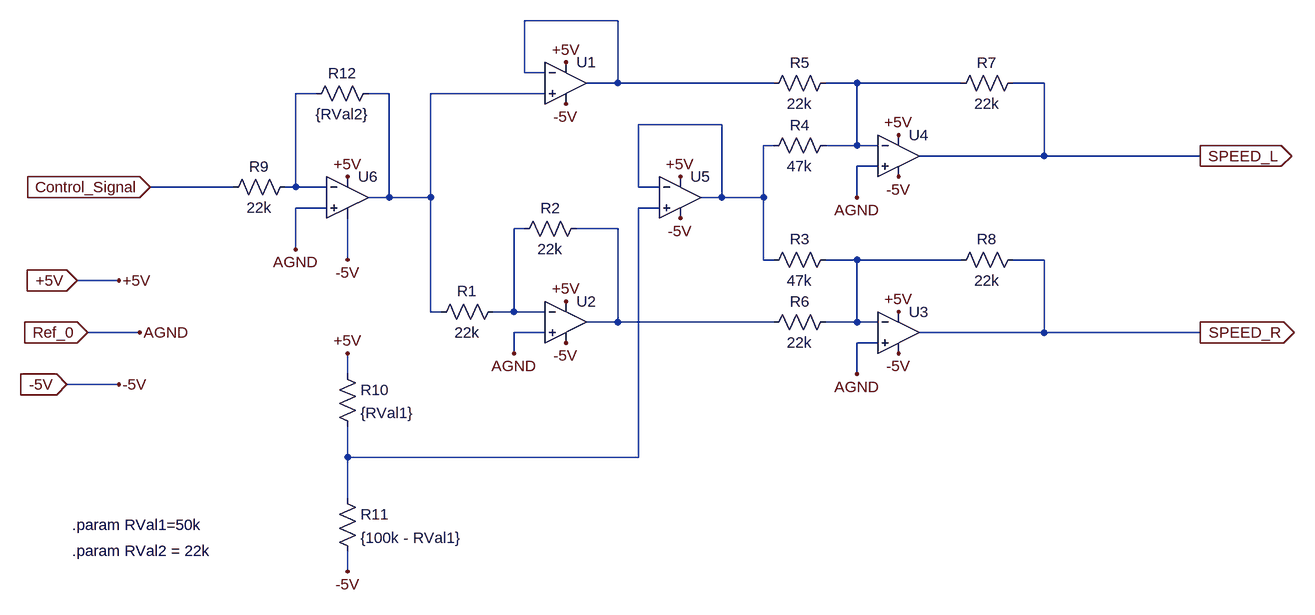
[diagram p0: schematic Differential_Drive_Mixer.asc]
Differential_Drive_Mixer.asc, the LTspice schematic file:
Version 4.1
SHEET 1 1508 1112
WIRE 80 -32 -64 -32
WIRE -64 48 -64 -32
WIRE -32 48 -64 48
WIRE 80 64 80 -32
WIRE 80 64 32 64
WIRE 320 64 80 64
WIRE 448 64 400 64
WIRE 608 64 448 64
WIRE 736 64 688 64
WIRE -384 80 -416 80
WIRE -272 80 -304 80
WIRE -32 80 -208 80
WIRE 240 128 112 128
WIRE 320 160 304 160
WIRE 448 160 448 64
WIRE 448 160 400 160
WIRE 480 160 448 160
WIRE 736 176 736 64
WIRE 736 176 544 176
WIRE 976 176 736 176
WIRE 480 192 448 192
WIRE -512 224 -640 224
WIRE -416 224 -416 80
WIRE -416 224 -432 224
WIRE -368 224 -416 224
WIRE 112 224 112 128
WIRE 144 224 112 224
WIRE -272 240 -272 80
WIRE -272 240 -304 240
WIRE -208 240 -208 80
WIRE -208 240 -272 240
WIRE 240 240 240 128
WIRE 240 240 208 240
WIRE 304 240 304 160
WIRE 304 240 240 240
WIRE 448 240 448 192
WIRE -368 256 -416 256
WIRE 144 256 112 256
WIRE -64 288 -80 288
WIRE 80 288 16 288
WIRE -416 320 -416 256
WIRE -336 336 -336 272
WIRE 304 336 304 240
WIRE 320 336 304 336
WIRE 448 336 400 336
WIRE 608 336 448 336
WIRE 736 336 688 336
WIRE -688 368 -752 368
WIRE -208 416 -208 240
WIRE -192 416 -208 416
WIRE -80 416 -80 288
WIRE -80 416 -112 416
WIRE -32 416 -80 416
WIRE 80 432 80 288
WIRE 80 432 32 432
WIRE 320 432 80 432
WIRE 448 432 448 336
WIRE 448 432 400 432
WIRE 480 432 448 432
WIRE -656 448 -736 448
WIRE -32 448 -80 448
WIRE 736 448 736 336
WIRE 736 448 544 448
WIRE 976 448 736 448
WIRE 480 464 448 464
WIRE -80 480 -80 448
WIRE -336 512 -336 480
WIRE 448 512 448 464
WIRE -688 528 -768 528
WIRE -336 640 -336 592
WIRE 112 640 112 256
WIRE 112 640 -336 640
WIRE -336 704 -336 640
WIRE -336 816 -336 784
FLAG -640 224 Control_Signal
IOPIN -640 224 In
FLAG -336 208 +5V
FLAG -336 336 -5V
FLAG 0 32 +5V
FLAG 0 96 -5V
FLAG 0 400 +5V
FLAG 512 480 -5V
FLAG 0 464 -5V
FLAG 512 416 +5V
FLAG 512 208 -5V
FLAG 512 144 +5V
FLAG 976 176 SPEED_L
IOPIN 976 176 Out
FLAG 976 448 SPEED_R
IOPIN 976 448 Out
FLAG 176 208 +5V
FLAG 176 272 -5V
FLAG -768 528 -5V
IOPIN -768 528 In
FLAG -688 528 -5V
FLAG -752 368 +5V
IOPIN -752 368 In
FLAG -688 368 +5V
FLAG 448 240 AGND
FLAG 448 512 AGND
FLAG -416 320 AGND
FLAG -80 480 AGND
FLAG -736 448 Ref_0
IOPIN -736 448 In
FLAG -656 448 AGND
FLAG -336 480 +5V
FLAG -336 816 -5V
SYMBOL OpAmps\\UniversalOpAmp2 0 64 R0
SYMATTR InstName U1
SYMATTR Value2 Avol=200k GBW=3Meg Slew=13Meg
SYMATTR SpiceLine Ilimit=25m Rail=1.5 Vos=3m
SYMATTR SpiceLine2 En=18n Enk=100 In=0.01p Ink=10 Rin=1T
SYMBOL OpAmps\\UniversalOpAmp2 0 432 R0
SYMATTR InstName U2
SYMATTR Value2 Avol=200k GBW=3Meg Slew=13Meg
SYMATTR SpiceLine Ilimit=25m Rail=1.5 Vos=3m
SYMATTR SpiceLine2 En=18n Enk=100 In=0.01p Ink=10 Rin=1T
SYMBOL res -96 400 R90
WINDOW 0 0 56 VBottom 2
WINDOW 3 32 56 VTop 2
SYMATTR InstName R1
SYMATTR Value 22k
SYMBOL res 32 272 R90
WINDOW 0 0 56 VBottom 2
WINDOW 3 32 56 VTop 2
SYMATTR InstName R2
SYMATTR Value 22k
SYMBOL res 416 320 R90
WINDOW 0 0 56 VBottom 2
WINDOW 3 32 56 VTop 2
SYMATTR InstName R3
SYMATTR Value 47k
SYMBOL res 416 144 R90
WINDOW 0 0 56 VBottom 2
WINDOW 3 32 56 VTop 2
SYMATTR InstName R4
SYMATTR Value 47k
SYMBOL res 416 48 R90
WINDOW 0 0 56 VBottom 2
WINDOW 3 32 56 VTop 2
SYMATTR InstName R5
SYMATTR Value 22k
SYMBOL res 416 416 R90
WINDOW 0 0 56 VBottom 2
WINDOW 3 32 56 VTop 2
SYMATTR InstName R6
SYMATTR Value 22k
SYMBOL OpAmps\\UniversalOpAmp2 512 448 R0
SYMATTR InstName U3
SYMATTR Value2 Avol=200k GBW=3Meg Slew=13Meg
SYMATTR SpiceLine Ilimit=25m Rail=1.5 Vos=3m
SYMATTR SpiceLine2 En=18n Enk=100 In=0.01p Ink=10 Rin=1T
SYMBOL OpAmps\\UniversalOpAmp2 512 176 R0
SYMATTR InstName U4
SYMATTR Value2 Avol=200k GBW=3Meg Slew=13Meg
SYMATTR SpiceLine Ilimit=25m Rail=1.5 Vos=3m
SYMATTR SpiceLine2 En=18n Enk=100 In=0.01p Ink=10 Rin=1T
SYMBOL res 704 48 R90
WINDOW 0 0 56 VBottom 2
WINDOW 3 32 56 VTop 2
SYMATTR InstName R7
SYMATTR Value 22k
SYMBOL res 704 320 R90
WINDOW 0 0 56 VBottom 2
WINDOW 3 32 56 VTop 2
SYMATTR InstName R8
SYMATTR Value 22k
SYMBOL OpAmps\\UniversalOpAmp2 176 240 R0
SYMATTR InstName U5
SYMATTR Value2 Avol=200k GBW=3Meg Slew=13Meg
SYMATTR SpiceLine Ilimit=25m Rail=1.5 Vos=3m
SYMATTR SpiceLine2 En=18n Enk=100 In=0.01p Ink=10 Rin=1T
SYMBOL OpAmps\\UniversalOpAmp2 -336 240 R0
SYMATTR InstName U6
SYMATTR Value2 Avol=200k GBW=3Meg Slew=13Meg
SYMATTR SpiceLine Ilimit=25m Rail=1.5 Vos=3m
SYMATTR SpiceLine2 En=18n Enk=100 In=0.01p Ink=10 Rin=1T
SYMBOL res -416 208 R90
WINDOW 0 0 56 VBottom 2
WINDOW 3 32 56 VTop 2
SYMATTR InstName R9
SYMATTR Value 22k
SYMBOL res -288 64 R90
WINDOW 0 0 56 VBottom 2
WINDOW 3 32 56 VTop 2
SYMATTR InstName R12
SYMATTR Value {RVal2}
SYMBOL res -352 496 R0
SYMATTR InstName R10
SYMATTR Value {RVal1}
SYMBOL res -352 688 R0
SYMATTR InstName R11
SYMATTR Value {100k - RVal1}
TEXT -760 744 Left 2 !.param RVal1=50k
TEXT -760 784 Left 2 !.param RVal2 = 22k

The netlist it stands for:
* Differential_Drive_Mixer.asc
X§U1 N004 N001 +5V -5V N001 level2 Avol=200k GBW=3Meg Slew=13Meg Ilimit=25m Rail=1.5 Vos=3m En=18n Enk=100 In=0.01p Ink=10 Rin=1T  ; pins In+ In- V+ V- OUT
X§U2 Ref_0 N007 +5V -5V N008 level2 Avol=200k GBW=3Meg Slew=13Meg Ilimit=25m Rail=1.5 Vos=3m En=18n Enk=100 In=0.01p Ink=10 Rin=1T  ; pins In+ In- V+ V- OUT
R1 N007 N004 22k
R2 N008 N007 22k
R3 N009 N005 47k
R4 N002 N005 47k
R5 N002 N001 22k
R6 N009 N008 22k
X§U3 Ref_0 N009 +5V -5V SPEED_R level2 Avol=200k GBW=3Meg Slew=13Meg Ilimit=25m Rail=1.5 Vos=3m En=18n Enk=100 In=0.01p Ink=10 Rin=1T  ; pins In+ In- V+ V- OUT
X§U4 Ref_0 N002 +5V -5V SPEED_L level2 Avol=200k GBW=3Meg Slew=13Meg Ilimit=25m Rail=1.5 Vos=3m En=18n Enk=100 In=0.01p Ink=10 Rin=1T  ; pins In+ In- V+ V- OUT
R7 SPEED_L N002 22k
R8 SPEED_R N009 22k
X§U5 N006 N005 +5V -5V N005 level2 Avol=200k GBW=3Meg Slew=13Meg Ilimit=25m Rail=1.5 Vos=3m En=18n Enk=100 In=0.01p Ink=10 Rin=1T  ; pins In+ In- V+ V- OUT
X§U6 Ref_0 N003 +5V -5V N004 level2 Avol=200k GBW=3Meg Slew=13Meg Ilimit=25m Rail=1.5 Vos=3m En=18n Enk=100 In=0.01p Ink=10 Rin=1T  ; pins In+ In- V+ V- OUT
R9 N003 Control_Signal 22k
R12 N004 N003 {RVal2}
R10 +5V N006 {RVal1}
R11 N006 -5V {100k - RVal1}
.param RVal1=50k
.param RVal2 = 22k
.lib UniversalOpAmp2.lib
.backanno
.end